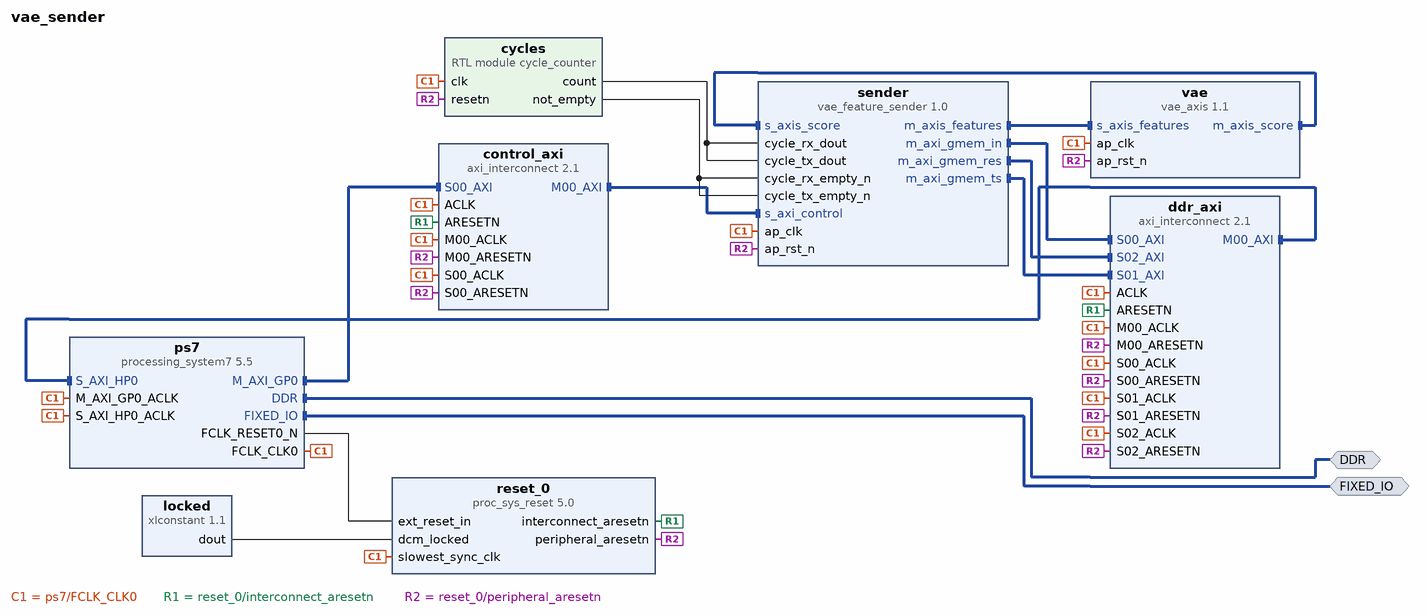
[diagram p0: block diagram of the top level]
# Vivado block design vae_sender, xc7z020clg400-1, Vivado 2023.2
create_bd_design vae_sender

create_bd_intf_port -mode Master -vlnv xilinx.com:interface:ddrx_rtl:1.0 DDR
create_bd_intf_port -mode Master -vlnv xilinx.com:display_processing_system7:fixedio_rtl:1.0 FIXED_IO

create_bd_cell -type ip -vlnv xilinx.com:ip:processing_system7:5.5 ps7
set_property -dict [list \
  CONFIG.PCW_APU_PERIPHERAL_FREQMHZ 650 \
  CONFIG.PCW_CRYSTAL_PERIPHERAL_FREQMHZ 50 \
  CONFIG.PCW_ENET0_ENET0_IO {MIO 16 .. 27} \
  CONFIG.PCW_ENET0_GRP_MDIO_ENABLE 1 \
  CONFIG.PCW_ENET0_GRP_MDIO_IO {MIO 52 .. 53} \
  CONFIG.PCW_ENET0_PERIPHERAL_ENABLE 1 \
  CONFIG.PCW_ENET0_RESET_ENABLE 1 \
  CONFIG.PCW_ENET0_RESET_IO {MIO 9} \
  CONFIG.PCW_ENET_RESET_ENABLE 1 \
  CONFIG.PCW_ENET_RESET_SELECT {Share reset pin} \
  CONFIG.PCW_FPGA0_PERIPHERAL_FREQMHZ 100 \
  CONFIG.PCW_FPGA1_PERIPHERAL_FREQMHZ 50 \
  CONFIG.PCW_GPIO_MIO_GPIO_ENABLE 1 \
  CONFIG.PCW_GPIO_MIO_GPIO_IO MIO \
  CONFIG.PCW_I2C_RESET_ENABLE 1 \
  CONFIG.PCW_M_AXI_GP0_FREQMHZ 10 \
  CONFIG.PCW_PERIPHERAL_BOARD_PRESET None \
  CONFIG.PCW_PRESET_BANK1_VOLTAGE {LVCMOS 1.8V} \
  CONFIG.PCW_QSPI_GRP_FBCLK_ENABLE 1 \
  CONFIG.PCW_QSPI_GRP_FBCLK_IO {MIO 8} \
  CONFIG.PCW_QSPI_GRP_SINGLE_SS_ENABLE 1 \
  CONFIG.PCW_QSPI_GRP_SINGLE_SS_IO {MIO 1 .. 6} \
  CONFIG.PCW_QSPI_PERIPHERAL_ENABLE 1 \
  CONFIG.PCW_QSPI_QSPI_IO {MIO 1 .. 6} \
  CONFIG.PCW_SD0_GRP_CD_ENABLE 1 \
  CONFIG.PCW_SD0_GRP_CD_IO {MIO 47} \
  CONFIG.PCW_SD0_GRP_WP_ENABLE 0 \
  CONFIG.PCW_SD0_PERIPHERAL_ENABLE 1 \
  CONFIG.PCW_SD0_SD0_IO {MIO 40 .. 45} \
  CONFIG.PCW_SDIO_PERIPHERAL_FREQMHZ 50 \
  CONFIG.PCW_SINGLE_QSPI_DATA_MODE x4 \
  CONFIG.PCW_S_AXI_HP0_FREQMHZ 10 \
  CONFIG.PCW_UART0_PERIPHERAL_ENABLE 1 \
  CONFIG.PCW_UART0_UART0_IO {MIO 14 .. 15} \
  CONFIG.PCW_UART1_PERIPHERAL_ENABLE 0 \
  CONFIG.PCW_UART_PERIPHERAL_FREQMHZ 100 \
  CONFIG.PCW_UIPARAM_DDR_BUS_WIDTH {16 Bit} \
  CONFIG.PCW_UIPARAM_DDR_FREQ_MHZ 525 \
  CONFIG.PCW_UIPARAM_DDR_PARTNO {MT41J256M16 RE-125} \
  CONFIG.PCW_USB0_PERIPHERAL_ENABLE 1 \
  CONFIG.PCW_USB0_RESET_ENABLE 1 \
  CONFIG.PCW_USB0_RESET_IO {MIO 46} \
  CONFIG.PCW_USB0_USB0_IO {MIO 28 .. 39} \
  CONFIG.PCW_USB_RESET_ENABLE 1 \
  CONFIG.PCW_USB_RESET_SELECT {Share reset pin} \
  CONFIG.PCW_USE_S_AXI_HP0 1 \
] [get_bd_cells ps7]
# 482 more settings of ps7 are not shown: defaults, MIO pin electricals, DDR timing, and values the tool derives
create_bd_cell -type ip -vlnv xilinx.com:ip:axi_interconnect:2.1 control_axi
set_property -dict {CONFIG.NUM_MI 1 CONFIG.NUM_SI 1} [get_bd_cells control_axi]
create_bd_cell -type ip -vlnv xilinx.com:ip:axi_interconnect:2.1 ddr_axi
set_property -dict {CONFIG.NUM_MI 1 CONFIG.NUM_SI 3} [get_bd_cells ddr_axi]
create_bd_cell -type ip -vlnv xilinx.com:ip:proc_sys_reset:5.0 reset_0
create_bd_cell -type ip -vlnv xilinx.com:ip:xlconstant:1.1 locked
set_property -dict {CONFIG.CONST_VAL 1} [get_bd_cells locked]
create_bd_cell -type ip -vlnv user.org:hls:vae_feature_sender:1.0 sender
create_bd_cell -type ip -vlnv user.org:hls:vae_axis:1.1 vae
create_bd_cell -type module -reference cycle_counter cycles

# ---- connections ----

connect_bd_intf_net [get_bd_intf_pins control_axi/M00_AXI] [get_bd_intf_pins sender/s_axi_control]
connect_bd_intf_net [get_bd_intf_pins ddr_axi/M00_AXI] [get_bd_intf_pins ps7/S_AXI_HP0]
connect_bd_intf_net [get_bd_intf_ports DDR] [get_bd_intf_pins ps7/DDR]
connect_bd_intf_net [get_bd_intf_ports FIXED_IO] [get_bd_intf_pins ps7/FIXED_IO]
connect_bd_intf_net [get_bd_intf_pins ps7/M_AXI_GP0] [get_bd_intf_pins control_axi/S00_AXI]
connect_bd_intf_net [get_bd_intf_pins sender/m_axi_gmem_in] [get_bd_intf_pins ddr_axi/S00_AXI]
connect_bd_intf_net [get_bd_intf_pins sender/m_axi_gmem_res] [get_bd_intf_pins ddr_axi/S02_AXI]
connect_bd_intf_net [get_bd_intf_pins sender/m_axi_gmem_ts] [get_bd_intf_pins ddr_axi/S01_AXI]
connect_bd_intf_net [get_bd_intf_pins sender/m_axis_features] [get_bd_intf_pins vae/s_axis_features]
connect_bd_intf_net [get_bd_intf_pins vae/m_axis_score] [get_bd_intf_pins sender/s_axis_score]
connect_bd_net [get_bd_pins cycles/count] [get_bd_pins sender/cycle_tx_dout] [get_bd_pins sender/cycle_rx_dout]
connect_bd_net [get_bd_pins cycles/not_empty] [get_bd_pins sender/cycle_tx_empty_n] [get_bd_pins sender/cycle_rx_empty_n]
connect_bd_net [get_bd_pins locked/dout] [get_bd_pins reset_0/dcm_locked]
connect_bd_net [get_bd_pins ps7/FCLK_CLK0] \
  [get_bd_pins ps7/M_AXI_GP0_ACLK] [get_bd_pins ps7/S_AXI_HP0_ACLK] [get_bd_pins control_axi/ACLK] \
  [get_bd_pins control_axi/S00_ACLK] [get_bd_pins control_axi/M00_ACLK] [get_bd_pins ddr_axi/ACLK] \
  [get_bd_pins ddr_axi/S00_ACLK] [get_bd_pins ddr_axi/S01_ACLK] [get_bd_pins ddr_axi/S02_ACLK] [get_bd_pins ddr_axi/M00_ACLK] \
  [get_bd_pins reset_0/slowest_sync_clk] [get_bd_pins sender/ap_clk] [get_bd_pins vae/ap_clk] [get_bd_pins cycles/clk]
connect_bd_net [get_bd_pins ps7/FCLK_RESET0_N] [get_bd_pins reset_0/ext_reset_in]
connect_bd_net [get_bd_pins reset_0/interconnect_aresetn] [get_bd_pins control_axi/ARESETN] [get_bd_pins ddr_axi/ARESETN]
connect_bd_net [get_bd_pins reset_0/peripheral_aresetn] \
  [get_bd_pins control_axi/S00_ARESETN] [get_bd_pins control_axi/M00_ARESETN] [get_bd_pins ddr_axi/S00_ARESETN] \
  [get_bd_pins ddr_axi/S01_ARESETN] [get_bd_pins ddr_axi/S02_ARESETN] [get_bd_pins ddr_axi/M00_ARESETN] \
  [get_bd_pins sender/ap_rst_n] [get_bd_pins vae/ap_rst_n] [get_bd_pins cycles/resetn]

# ---- address map ----
assign_bd_address -offset 0x40000000 -range 64K -target_address_space [get_bd_addr_spaces ps7/Data] [get_bd_addr_segs sender/s_axi_control/Reg]
assign_bd_address -offset 0x0000000000000000 -range 512M -target_address_space [get_bd_addr_spaces sender/Data_m_axi_gmem_in] [get_bd_addr_segs ps7/S_AXI_HP0/HP0_DDR_LOWOCM]
assign_bd_address -offset 0x0000000000000000 -range 512M -target_address_space [get_bd_addr_spaces sender/Data_m_axi_gmem_res] [get_bd_addr_segs ps7/S_AXI_HP0/HP0_DDR_LOWOCM]
assign_bd_address -offset 0x0000000000000000 -range 512M -target_address_space [get_bd_addr_spaces sender/Data_m_axi_gmem_ts] [get_bd_addr_segs ps7/S_AXI_HP0/HP0_DDR_LOWOCM]

validate_bd_design
save_bd_design
